# EasyEDA Pro project High-Speed Comparator.eprj

# Schematic Schematic1
Board Name: Board1; Create Date: 2026-07-07; Page Name: P1; Project Name: High-Speed Comparator; Schematic Name: Schematic1; Update Date: 2026-07-07; Company: 嘉立创EDA; Page Size: A4; Version: V1.0
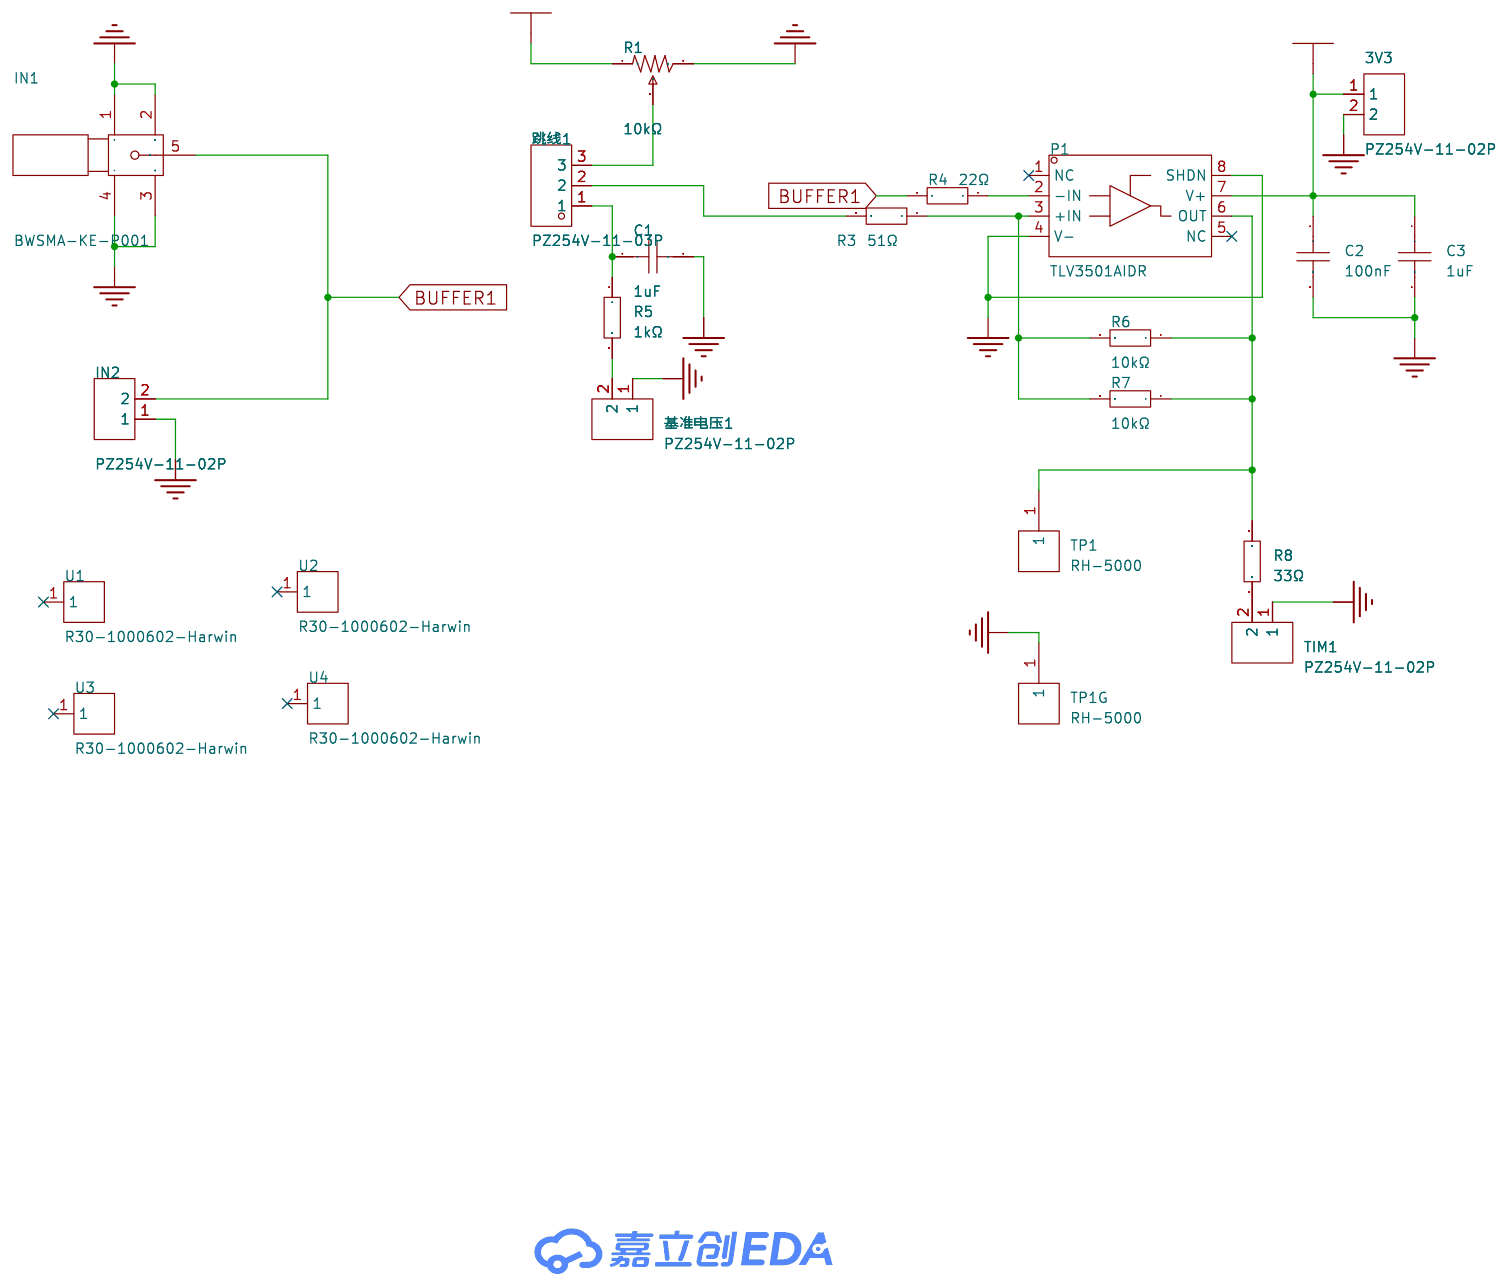
[diagram p0: schematic sheet]

## Parts
3V3  PZ254V-11-02P  [HDR-TH_2P-P2.54-V-M]
C1  1uF  [C0805]
C2  100nF  [C0805]
C3  1uF  [C0805]
IN1  BWSMA-KE-P001  [SMA-SMD_BWSMA-KE-P001]
IN2  PZ254V-11-02P  [HDR-TH_2P-P2.54-V-M]
P1  TLV3501AIDR  [SOP-8_L4.9-W3.9-P1.27-LS6.0-BL]
R1  10kΩ  [RES-ADJ-TH_3296W]
R3  51Ω  [R0805]
R4  22Ω  [R0805]
R5  1kΩ  [R0805]
R6  10kΩ  [R0805]
R7  10kΩ  [R0805]
R8  33Ω  [R0805]
TIM1  PZ254V-11-02P  [HDR-TH_2P-P2.54-V-M]
TP1  RH-5000  [TEST-TH_BD2.54-P1.4_RED]
TP1G  RH-5000  [TEST-TH_BD2.54-P1.4_RED]
U1  R30-1000602-Harwin  [SMD_BD5.0-D3.0]
U2  R30-1000602-Harwin  [SMD_BD5.0-D3.0]
U3  R30-1000602-Harwin  [SMD_BD5.0-D3.0]
U4  R30-1000602-Harwin  [SMD_BD5.0-D3.0]
基准电压1  PZ254V-11-02P  [HDR-TH_2P-P2.54-V-M]
跳线1  PZ254V-11-03P  [HDR-TH_3P-P2.54-V-M]

## Library data of the parts
3V3 IN2 TIM1 基准电压1 = PZ254V-11-02P: 插针结构:1x2P;间距:2.54mm;行距:-;圆针/方针:方针;安装方式:直插;排数:单排;总PIN位数:2P;额定电流:-;额定电压:-;配合针长度:6mm;塑高:2.5mm;端接针长度:3mm;触头材质:黄铜;触头镀层:-;工作温度:-40℃~+105℃;颜色:黑色;; LCSC Part Name: 1x2P 间距:2.54mm 方针 直插; Supplier Part: C492401; Manufacturer: XFCN(兴飞); Supplier Footprint: 插件,P=2.54mm; JLCPCB Part Class: Extended Part; Datasheet: https://item.szlcsc.com/datasheet/PZ254V-11-02P/502957.html; Supplier: LCSC; Pin Structure: 1x2P; Pitch: 2.54mm; Circluar Pins/Square Pins: 方针; Mounting Type: 直插; Number of Rows: 单排; Number of Pins: 2P; Length of Mating Pin: 6mm; Insulation Height: 2.5mm; Length of End Connection Pin: 3mm; Contact Material: 黄铜; Operating Temperature: -40℃~+105℃; Color: 黑色
C1 C3 = CL21B105KBFNNNE: 容值:1uF;精度:±10%;额定电压:50V;温度系数:X7R;; LCSC Part Name: 1uF ±10% 50V; Supplier Part: C28323; Manufacturer: SAMSUNG(三星); Supplier Footprint: 0805; JLCPCB Part Class: Basic Part; Datasheet: https://item.szlcsc.com/datasheet/CL21B105KBFNNNE/29074.html; Supplier: LCSC; Tolerance: ±10%; Voltage Rating: 50V; Temperature Coefficient: X7R
C2 = CC0805KRX7R9BB104: LCSC Part Name: 100nF ±10% 50V; Supplier Part: C49678; Manufacturer: YAGEO(国巨); Supplier Footprint: 0805; JLCPCB Part Class: Basic Part; Datasheet: https://item.szlcsc.com/datasheet/CC0805KRX7R9BB104/50686.html; Supplier: LCSC; Tolerance: ±10%; Voltage Rating: 50V; Temperature Coefficient: X7R
IN1 = BWSMA-KE-P001: 连接器类型:板端;射频系列:SMA;接口类型:内孔;端口数量:1;阻抗:-;频率-最大值:-;样式:偏脚;接口直径:5.2mm;接口长度/高度:-;工作温度范围:-;; LCSC Part Name: SMA 内孔 偏脚; Supplier Part: C496550; Manufacturer: BAT WIRELESS(蝙蝠无线); Supplier Footprint: 插件; JLCPCB Part Class: Extended Part; Datasheet: https://atta.szlcsc.com/upload/public/pdf/source/20200416/C496550_06668BF2E3B968EA39F96D17E7156373.pdf; Supplier: LCSC; Connector Type: 板端; RF Series: SMA; Interface Type: 内孔; Number of Ports: 1; Style: 偏脚; Interface Diameter: 5.2mm
P1 = TLV3501AIDR: 比较器数:单路;输入失调电压(Vos):1mV;输入偏置电流(Ib):2pA;轨到轨:轨到轨输入,轨到轨输出;; LCSC Part Name: 4.5纳秒轨到轨高速比较器在微小封装中; Supplier Part: C43484; Manufacturer: TI(德州仪器); Supplier Footprint: SOP-8; JLCPCB Part Class: 扩展库; Datasheet: https://www.ti.com/cn/lit/gpn/tlv3501; Supplier: LCSC; Number of Channels: 单路; Vos - Input Offset Voltage: 1mV; Ib - Input Bias Current: 2pA; Propagation Delay Time: 4.5ns; Input Hysteresis Voltage (Vhys): 6mV; Output Type: TTL；CMOS; Rail to Rail: 轨到轨输入,轨到轨输出; Quiescent Current: 3.2mA; Operating Temperature: -40℃~+125℃
R1 = 3296W-1-103_C48997937: 阻值:10kΩ;精度:±10%;功率:500mW;温度系数:±250ppm/℃;; LCSC Part Name: 玻璃釉预调电位器; Supplier Part: C48997937; Manufacturer: JIERR(捷而瑞); Manufacturer Part: 3296W-1-103; Supplier Footprint: 插件-3P,9.5x4.9mm; JLCPCB Part Class: Extended Part; Datasheet: https://item.szlcsc.com/datasheet/3296W-1-103/51342073.html; Supplier: LCSC; Tolerance: ±10%; Power(Watts): 500mW; Temperature Coefficient: ±250ppm/℃; Number of Turns: 28
R3 = 0805W8F510JT5E: 电阻类型:厚膜电阻;阻值:51Ω;精度:±1%;功率:125mW;工作电压:150V;温度系数:±100ppm/℃;; LCSC Part Name: 51Ω ±1% 125mW 厚膜电阻; Supplier Part: C17738; Manufacturer: UNI-ROYAL(厚声); Supplier Footprint: 0805; JLCPCB Part Class: Basic Part; Datasheet: https://item.szlcsc.com/datasheet/0805W8F510JT5E/18426.html; Supplier: LCSC; Type: 厚膜电阻; Tolerance: ±1%; Power(Watts): 125mW; Voltage-Supply(Max): 150V; Temperature Coefficient: ±100ppm/℃; Operating Temperature: -55℃~+155℃
R4 = 0805W8F220JT5E: 电阻类型:厚膜电阻;阻值:22Ω;精度:±1%;功率:125mW;工作电压:150V;温度系数:±100ppm/℃;; LCSC Part Name: 22Ω ±1% 125mW 厚膜电阻; Supplier Part: C17561; Manufacturer: UNI-ROYAL(厚声); Supplier Footprint: 0805; JLCPCB Part Class: Basic Part; Datasheet: https://item.szlcsc.com/datasheet/0805W8F220JT5E/18249.html; Supplier: LCSC; Type: 厚膜电阻; Tolerance: ±1%; Power(Watts): 125mW; Voltage-Supply(Max): 150V; Temperature Coefficient: ±100ppm/℃; Operating Temperature: -55℃~+155℃
R5 = 0805W8F1001T5E: 电阻类型:厚膜电阻;阻值:1kΩ;精度:±1%;功率:125mW;最大工作电压:150V;温度系数:±100ppm/℃;; LCSC Part Name: 1kΩ ±1% 125mW 厚膜电阻; Supplier Part: C17513; Manufacturer: UNI-ROYAL(厚声); Supplier Footprint: 0805; JLCPCB Part Class: Basic Part; Datasheet: https://atta.szlcsc.com/upload/public/pdf/source/20200306/C422600_1E6D84923E4A46A82E41ADD87F860B5C.pdf; Supplier: LCSC; Type: 厚膜电阻; Tolerance: ±1%; Power(Watts): 125mW; Overload Voltage (Max): 150V; Temperature Coefficient: ±100ppm/℃; Operating Temperature Range: -55℃~+155℃
R6 R7 = 0805W8F1002T5E_C17414: 电阻类型:厚膜电阻;阻值:10kΩ;精度:±1%;功率:125mW;工作电压:150V;温度系数:±100ppm/℃;; LCSC Part Name: 10kΩ ±1% 125mW 厚膜电阻; Supplier Part: C17414; Manufacturer: UNI-ROYAL(厚声); Manufacturer Part: 0805W8F1002T5E; Supplier Footprint: 0805; JLCPCB Part Class: Basic Part; Datasheet: https://item.szlcsc.com/datasheet/0805W8F1002T5E/18102.html; Supplier: LCSC; Type: 厚膜电阻; Tolerance: ±1%; Power(Watts): 125mW; Voltage-Supply(Max): 150V; Temperature Coefficient: ±100ppm/℃; Operating Temperature: -55℃~+155℃
R8 = 0805W8F330JT5E: 电阻类型:厚膜电阻;阻值:33Ω;精度:±1%;功率:125mW;工作电压:150V;温度系数:±200ppm/℃;; LCSC Part Name: 33Ω ±1% 125mW 厚膜电阻; Supplier Part: C17634; Manufacturer: UNI-ROYAL(厚声); Supplier Footprint: 0805; JLCPCB Part Class: Basic Part; Datasheet: https://item.szlcsc.com/datasheet/0805W8F330JT5E/18322.html; Supplier: LCSC; Type: 厚膜电阻; Tolerance: ±1%; Power(Watts): 125mW; Voltage-Supply(Max): 150V; Temperature Coefficient: ±200ppm/℃; Operating Temperature: -55℃~+155℃
TP1 TP1G = RH-5000: LCSC Part Name: PCB电路板测试点/测试针; Supplier Part: C5277086; Manufacturer: 荣和; JLCPCB Part Class: 扩展库; Datasheet: https://item.szlcsc.com/datasheet/RH-5000/6009931.html; Supplier: LCSC; Connector Type: 插针型(穿板); Plastic Color: 红色; Board Space (Diameter φ/ Length x Width): 2.5mm
U1-U4 = R30-1000602-Harwin: LCSC Part Name: HARWIN M3 x 0.5六角黄铜螺母柱,6mm总长,5mm六角对边, R30-1000602 rs1613559; Supplier Part: C47018769; Manufacturer: Harwin; JLCPCB Part Class: 扩展库; Datasheet: https://item.szlcsc.com/datasheet/R30-1000602-Harwin/49200836.html; Supplier: LCSC
跳线1 = PZ254V-11-03P: 间距:2.54mm;总PIN位数:3;排数:1;插针结构:1x3P;行距:-;安装类型:直插;圆针/方针:方针;额定电流:-;额定电压:-;配合针长度:6mm;塑高:2.5mm;端接针长度:3mm;触头材质:黄铜;触头镀层:-;工作温度范围:-40℃~+105℃;颜色:黑色;; LCSC Part Name: 2.54mm 1x3P 直插 方针; Supplier Part: C492402; Manufacturer: XFCN(兴飞); Supplier Footprint: 插件,P=2.54mm; JLCPCB Part Class: Extended Part; Datasheet: https://atta.szlcsc.com/upload/public/pdf/source/20200309/C492402_8335C3D49C4E4C618838D59BB1D024C1.pdf; Supplier: LCSC; Pitch: 2.54mm; Number of Pins: 3; Number of Rows: 1; Pin Structure: 1x3P; Mounting Type: 直插; Circluar Pins/Square Pins: 方针; Length of Mating Pin: 6mm; Insulation Height: 2.5mm; Length of End Connection Pin: 3mm; Contact Material: 黄铜; Operating Temperature Range: -40℃~+105℃; Color: 黑色

## Nets
3V3: 3V3.1 C2.1 C3.1 P1.7(V+) R1.1
GND: 3V3.2 C1.2 C2.2 C3.2 IN1.1 IN1.2 IN1.3 IN1.4 IN2.1 P1.4(V-) P1.8(SHDN) R1.3 TIM1.1 TP1G.1 基准电压1.1
BUFFER1: IN1.5 IN2.2 R4.2
$1N1285: R5.2 基准电压1.2
$1N1287: C1.1 R5.1 跳线1.1
$1N1288: R3.2 跳线1.2
$1N1289: R1.2 跳线1.3
$1N1292: P1.2(-IN) R4.1
$1N1293: P1.3(+IN) R3.1 R6.2 R7.2
$1N1296: P1.6(OUT) R6.1 R7.1 R8.1 TP1.1
$1N1300: R8.2 TIM1.2

Not connected (* = marked no-connect by the designer): P1 1(NC)* 5(NC)*; U1 1*; U2 1*; U3 1*; U4 1*

# Board PCB1
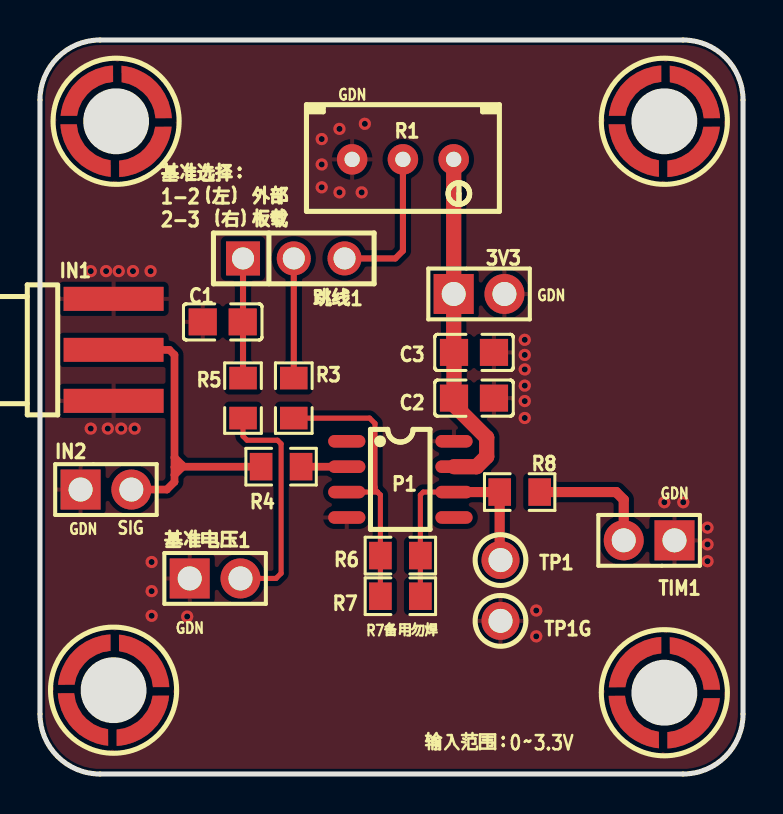
[diagram p1: board, top side]
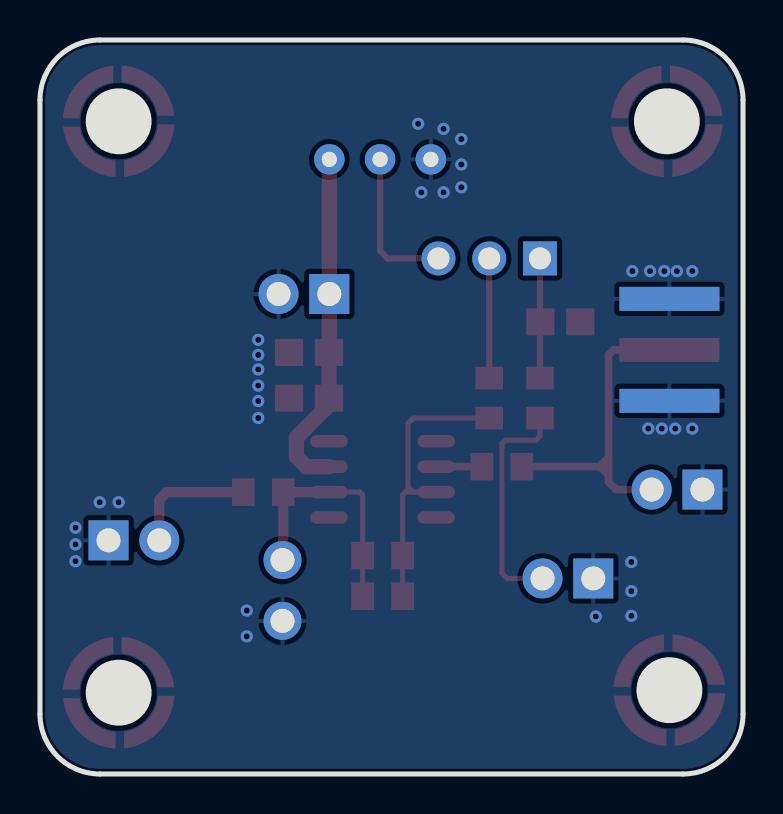
[diagram p2: board, bottom side, seen from below]

Outline 35.18 x 36.7 mm; copper layers: Top Layer, Bottom Layer. Coordinates in mm from the lower left corner of the outline.
Outline path: 0,33.7 0,3 arc(0.88,0.88) 3,0 32.18,0 arc(34.3,0.88) 35.18,3 35.18,33.7 arc(34.3,35.82) 32.18,36.7 3,36.7 arc(0.88,35.82) 0,33.7
Stack: Top Layer 0.035mm / Dielectric1 1.51mm FR4 er 4.5 / Bottom Layer 0.035mm

## Design rules (mm)
template: JLCPCB Capability(Two Layers Board)
spacing copperThickness1oz (default): track to track 0.102, other pairs 0.152 to 0.3
spacing copperThickness2oz: track to track 0.203, other pairs 0.152 to 0.3
track width copperThickness1oz (default): min 0.127, default 0.254, max 2.54
track width copperThickness2oz: min 0.203, default 0.254, max 2.54
differential pair differentialPair (default): width min 0.127, default 0.254, max 2.54; gap min 0.152, default 0.152
via viaSize (default): diameter min 0.5, default 0.61, max 10; hole min 0.3, default 0.305, max 6.3

## Placement (name value [footprint] x y rotation side)
3V3  PZ254V-11-02P  [HDR-TH_2P-P2.54-V-M]  21.97 24 0 top
C1  1uF  [C0805]  9.14 22.61 180 top
C2  100nF  [C0805]  21.72 18.8 0 top
C3  1uF  [C0805]  21.72 21.08 0 top
IN1  BWSMA-KE-P001  [SMA-SMD_BWSMA-KE-P001]  3.68 21.21 180 top
IN2  PZ254V-11-02P  [HDR-TH_2P-P2.54-V-M]  3.3 14.22 0 top
P1  TLV3501AIDR  [SOP-8_L4.9-W3.9-P1.27-LS6.0-BL]  18.03 14.73 270 top
R1  10kΩ  [RES-ADJ-TH_3296W]  18.16 30.73 270 top
R3  51Ω  [R0805]  12.7 18.8 90 top
R4  22Ω  [R0805]  12.06 15.37 180 top
R5  1kΩ  [R0805]  10.16 18.8 270 top
R6  10kΩ  [R0805]  18.03 10.92 180 top
R7  10kΩ  [R0805]  18.03 8.89 180 top
R8  33Ω  [R0805]  24 14.1 0 top
TIM1  PZ254V-11-02P  [HDR-TH_2P-P2.54-V-M]  30.48 11.68 180 top
TP1  RH-5000  [TEST-TH_BD2.54-P1.4_RED]  23.04 10.7 0 top
TP1G  RH-5000  [TEST-TH_BD2.54-P1.4_RED]  23.04 7.66 0 top
U1  R30-1000602-Harwin  [SMD_BD5.0-D3.0]  3.81 32.64 0 top
U2  R30-1000602-Harwin  [SMD_BD5.0-D3.0]  31.24 32.64 0 top
U3  R30-1000602-Harwin  [SMD_BD5.0-D3.0]  3.68 4.19 0 top
U4  R30-1000602-Harwin  [SMD_BD5.0-D3.0]  31.24 4.06 0 top
基准电压1  PZ254V-11-02P  [HDR-TH_2P-P2.54-V-M]  8.76 9.78 0 top
跳线1  PZ254V-11-03P  [HDR-TH_3P-P2.54-V-M]  12.7 25.78 0 top

## Footprints (pads in the part's own frame, mm; a bottom-side part is the same pattern mirrored in y, then rotated)
C0805
  rect 1.41x1.35 smd: 1(-1,0) 2(1,0)
HDR-TH_2P-P2.54-V-M
  rect 2x2 hole 1.2: 1(-1.27,0)
  round 2 hole 1.2: 2(1.27,0)
HDR-TH_3P-P2.54-V-M
  rect 1.7x1.7 hole 1.1: 1(-2.54,0)
  round 1.7 hole 1.1: 2(0,0) 3(2.54,0)
R0805
  rect 1.133x1.377 smd: 1(-1,0) 2(1,0)
RES-ADJ-TH_3296W
  round 1.524 hole 0.762: 1(0,2.54) 2(0,0) 3(0,-2.54)
SMA-SMD_BWSMA-KE-P001
  rect 5x1.2 smd: 1(0,-2.55) 2(0,2.55) 5(0,0)
  rect 5x1.2 smd far side: 3(0,2.55) 4(0,-2.55)
SMD_BD5.0-D3.0
  custom 2.52x2.628 smd: 1(-1.529,-1.792) 1(1.529,1.792)
  custom 2.629x2.52 smd: 1(-1.466,1.847) 1(1.465,-1.847)
SOP-8_L4.9-W3.9-P1.27-LS6.0-BL
  oval 0.63x1.865 smd: 1(-1.905,-2.683) 2(-0.635,-2.683) 3(0.635,-2.683) 4(1.905,-2.683) 5(1.905,2.683) 6(0.635,2.683) 7(-0.635,2.683) 8(-1.905,2.683)
TEST-TH_BD2.54-P1.4_RED
  round 1.9 hole 1.2: 1(0,0)

## Nets
As in the schematic.

Pads without a net: P1 1 5; U1 1; U2 1; U3 1; U4 1

## Via types
v1: diameter 0.61, hole 0.305, Top Layer to Bottom Layer, 33 vias

## Routing (per net, layer and track width the routed paths; a pad name or vN(x,y) marks a point on that pad's centre or on a via; arc(x,y) is an arc through that point)
3V3: length 17.4
  Top Layer w0.762: R1.1 3V3.1 20.7,21.1 C3.1 C2.1 ; 20.72,18.8 20.72,18.45 22.35,16.82 22.35,15.88 21.84,15.37 P1.7
GND:
  vias: v1(2.54,25.15) v1(2.54,17.27) v1(3.31,25.15) v1(3.39,17.27) v1(3.94,25.15) v1(4.07,17.27) v1(4.65,25.15) v1(4.74,17.27) v1(5.54,25.15) v1(5.59,10.6) v1(5.59,9.14) v1(5.59,7.91) v1(7.37,7.87) v1(14.1,31.75) v1(14.1,30.48) v1(14.1,29.34) v1(14.99,32.26) v1(14.99,29.08) v1(16.1,29.08) v1(16.26,32.51) v1(24.26,21.71) v1(24.26,20.95) v1(24.26,20.23) v1(24.26,19.42) v1(24.26,18.65) v1(24.26,17.8) v1(24.83,8.17) v1(24.83,6.88) v1(31.24,13.59) v1(32.19,13.59) v1(33.4,12.32) v1(33.4,11.48) v1(33.4,10.64)
BUFFER1: length 17.3
  Top Layer w0.381: 6.73,15.83 7.11,15.45 7.11,15.37 ; 6.73,15.83 6.73,20.95 6.48,21.21 IN1.5 ; 6.73,15.83 6.73,15.34 ; 6.73,14.95 6.73,14.61 6.35,14.22 IN2.2 ; 6.73,14.95 6.73,15.34 ; 6.73,14.95 7.11,15.33 7.11,15.37 ; 6.73,15.34 6.75,15.37 7.11,15.37 ; R4.2 7.11,15.37
$1N1285: length 11.6
  Top Layer w0.254: 10.03,9.78 11.81,9.78 12.06,10.03 12.06,16.51 11.89,16.69 10.36,16.69 10.16,16.89 R5.2
$1N1287: length 6
  Top Layer w0.305: R5.1 10.16,22.59 C1.1 10.16,22.62 跳线1.1
$1N1288: length 6
  Top Layer w0.305: R3.2 跳线1.2
$1N1289: length 7.7
  Top Layer w0.305: 跳线1.3 17.78,25.78 18.16,26.16 R1.2
$1N1292: length 2.3
  Top Layer w0.381: R4.1 P1.2
$1N1293: length 14.8
  Top Layer w0.254: 16.89,14.1 16.76,14.22 16.76,14.35 ; 16.89,14.1 17.03,13.95 R6.2 R7.2 ; 16.89,14.1 16.51,14.1 ; 16.76,14.35 16.51,14.1 ; 16.76,14.35 16.76,17.53 16.49,17.8 R3.1 ; 16.51,14.1 P1.3
$1N1296: length 12.5
  Top Layer w0.254: P1.6 19.18,14.1 19.03,13.95 R6.1 R7.1
  Top Layer w0.508: TP1.1 23,10.74 R8.1 P1.6
$1N1300: length 6.4
  Top Layer w0.508: TIM1.2 29.21,13.72 28.83,14.1 R8.2

## Copper pours and planes (outline as drawn; the poured copper is in the pictures)
GND on Top Layer: -1.02,37.21 35.94,37.21 35.94,-0.64 -1.02,-0.64
GND on Bottom Layer: -2.79,38.35 36.96,38.35 36.96,-2.29 -2.79,-2.29

## Text on the board
Top Silkscreen Layer: GDN | SIG | R7备用勿焊 | 输入范围：0～3.3V | 基准选择： / 1-2（左） 外部 / 2-3 （右）板载
